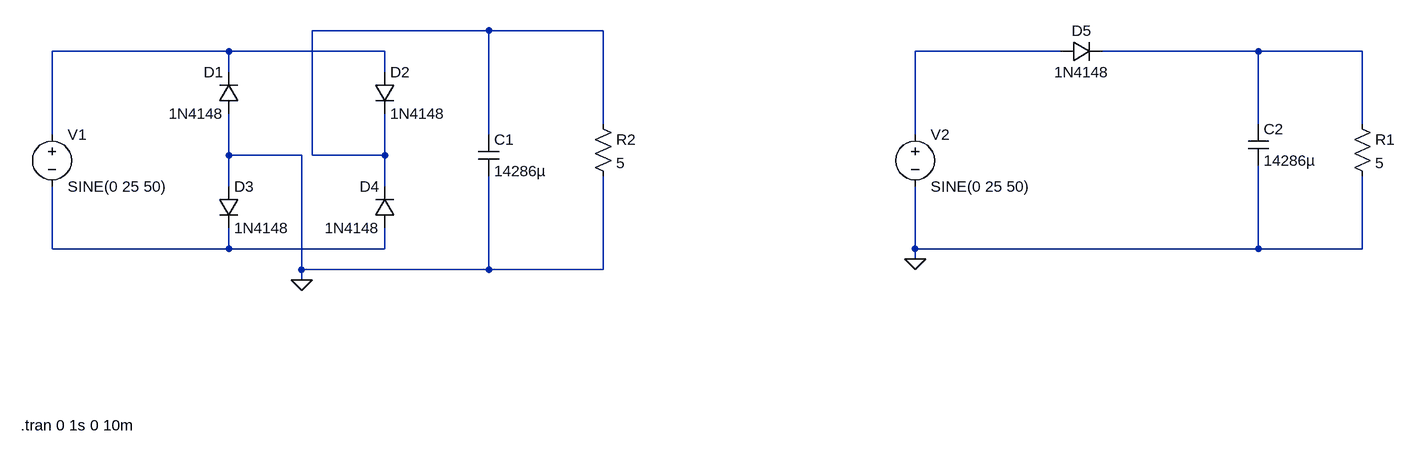
[diagram p0: schematic Raddrizzatore e filtro.asc]
Raddrizzatore e filtro.asc, the LTspice schematic file:
Version 4
SHEET 1 3308 1216
WIRE -1312 592 -1584 592
WIRE -1136 592 -1312 592
WIRE -1712 624 -1984 624
WIRE -1472 624 -1712 624
WIRE -432 624 -656 624
WIRE -128 624 -368 624
WIRE 32 624 -128 624
WIRE -1712 656 -1712 624
WIRE -1472 656 -1472 624
WIRE -1136 736 -1136 592
WIRE -128 736 -128 624
WIRE 32 736 32 624
WIRE -1984 752 -1984 624
WIRE -1312 752 -1312 592
WIRE -656 752 -656 624
WIRE -1712 784 -1712 720
WIRE -1600 784 -1712 784
WIRE -1584 784 -1584 592
WIRE -1472 784 -1472 720
WIRE -1472 784 -1584 784
WIRE -1712 832 -1712 784
WIRE -1472 832 -1472 784
WIRE -1984 928 -1984 832
WIRE -1712 928 -1712 896
WIRE -1712 928 -1984 928
WIRE -1472 928 -1472 896
WIRE -1472 928 -1712 928
WIRE -656 928 -656 832
WIRE -128 928 -128 800
WIRE -128 928 -656 928
WIRE 32 928 32 816
WIRE 32 928 -128 928
WIRE -656 944 -656 928
WIRE -1600 960 -1600 784
WIRE -1312 960 -1312 816
WIRE -1312 960 -1600 960
WIRE -1136 960 -1136 816
WIRE -1136 960 -1312 960
WIRE -1600 976 -1600 960
FLAG -1600 976 0
FLAG -656 944 0
SYMBOL voltage -1984 736 R0
WINDOW 123 0 0 Left 0
WINDOW 39 0 0 Left 0
SYMATTR InstName V1
SYMATTR Value SINE(0 25 50)
SYMBOL diode -1696 720 R180
WINDOW 0 24 64 Left 2
WINDOW 3 24 0 Left 2
SYMATTR InstName D1
SYMATTR Value 1N4148
SYMBOL diode -1488 656 R0
SYMATTR InstName D2
SYMATTR Value 1N4148
SYMBOL diode -1728 832 R0
SYMATTR InstName D3
SYMATTR Value 1N4148
SYMBOL diode -1456 896 R180
WINDOW 0 24 64 Left 2
WINDOW 3 24 0 Left 2
SYMATTR InstName D4
SYMATTR Value 1N4148
SYMBOL cap -1328 752 R0
SYMATTR InstName C1
SYMATTR Value 14286µ
SYMBOL voltage -656 736 R0
WINDOW 123 0 0 Left 0
WINDOW 39 0 0 Left 0
SYMATTR InstName V2
SYMATTR Value SINE(0 25 50)
SYMBOL cap -144 736 R0
SYMATTR InstName C2
SYMATTR Value 14286µ
SYMBOL diode -432 640 R270
WINDOW 0 32 32 VTop 2
WINDOW 3 0 32 VBottom 2
SYMATTR InstName D5
SYMATTR Value 1N4148
SYMBOL res 16 720 R0
SYMATTR InstName R1
SYMATTR Value 5
SYMBOL res -1152 720 R0
SYMATTR InstName R2
SYMATTR Value 5
TEXT -2032 1200 Left 2 !.tran 0 1s 0 10m

The netlist it stands for:
* Raddrizzatore e filtro.asc
V1 N002 N005 SINE(0 25 50)
D1 0 N002 1N4148
D2 N002 N001 1N4148
D3 0 N005 1N4148
D4 N005 N001 1N4148
C1 N001 0 14286µ
V2 N003 0 SINE(0 25 50)
C2 N004 0 14286µ
D5 N003 N004 1N4148
R1 N004 0 5
R2 N001 0 5
.model D D
.lib standard.dio
.tran 0 1s 0 10m
.backanno
.end